# Altium schematic sheet Encoder_Sheet1.SchDoc
size 420 x 297 mm; SheetNumber: 10; SheetTotal: 26
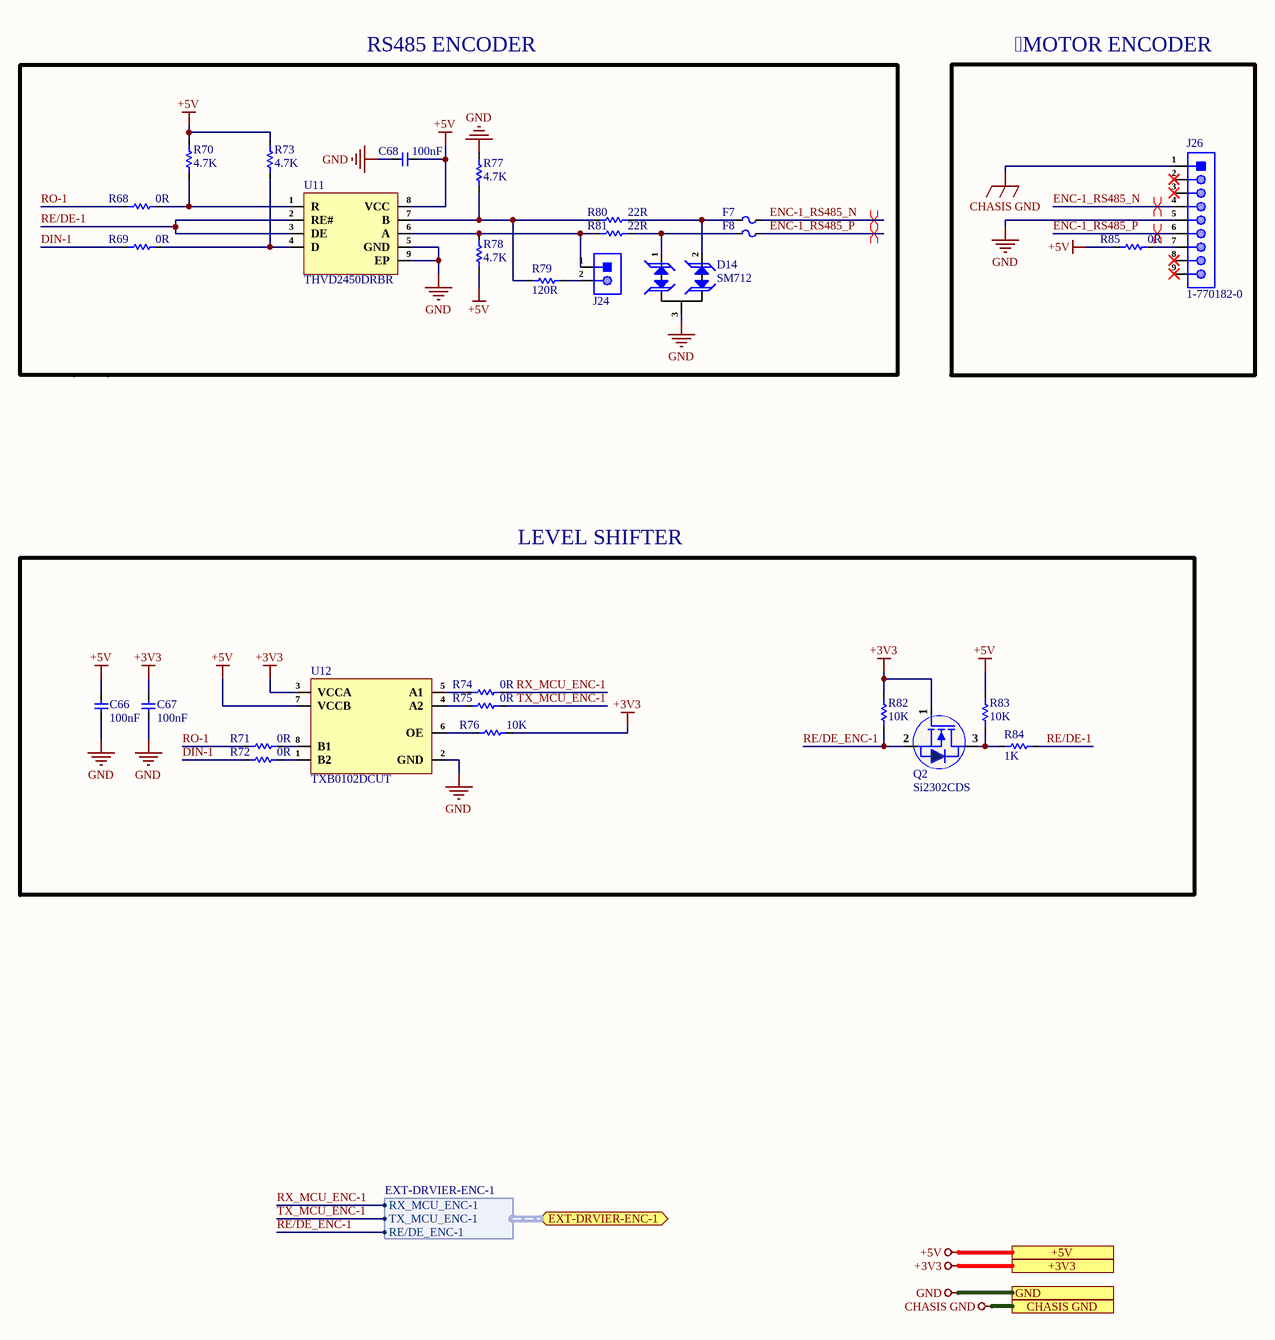
[diagram p0: Encoder_Sheet1.SchDoc]

## Parts
C66  100nF  [cap-0402]
C67  100nF  [cap-0402]
C68  100nF  [cap-0402]
D14  SM712  [SOT-23]
F7  MF-MSMF010-2  [Fuse-1812_]  (value not drawn)
F8  MF-MSMF010-2  [Fuse-1812_]  (value not drawn)
J24  X6511WV-02H-C60D30  [HDR1X2_]  (value not drawn)
J26  1-770182-0  [1-770182-0]
Q2  Si2302CDS  [Sot-23]
R68  0R  [Res-0402]
R69  0R  [Res-0402]
R70  4.7K  [Res-0402]
R71  0R  [Res-0402]
R72  0R  [Res-0402]
R73  4.7K  [Res-0402]
R74  0R  [Res-0402]
R75  0R  [Res-0402]
R76  10K  [Res-0402]
R77  4.7K  [Res-0402]
R78  4.7K  [Res-0402]
R79  120R  [Res-0603]
R80  22R  [Res-0201]
R81  22R  [Res-0201]
R82  10K  [Res-0402]
R83  10K  [Res-0402]
R84  1K  [Res-0603]
R85  0R  [Res-0402]
U11  THVD2450DRBR  [SON-8-EP(3x3)]
U12  TXB0102DCUT  [TXB0102DCUT]

## Ports
+3V3 (see Servo1[5B], CAN_Sheet[4D], Controller_Sheet[5D], DIO_1[5D], DIO_2[5D], DIO_3[5D], DIO_4[5D], Encoder_Sheet2[4D], Encoder_Sheet3[4D], Encoder_Sheet4[5D], EtherCAT_Sheet[5D], Motor_Driver_Sheet1[5D], Motor_Driver_Sheet2[5D], Motor_Driver_Sheet3[5D], Motor_Driver_Sheet4[5D], Power_Sheet[5D], RS485_RS232_Sheet[5D], Sec_Controller_Sheet1[5D], Sec_Controller_Sheet2[5D], Sec_Controller_Sheet3[5D], Sec_Controller_Sheet4[5D], Servo1[5D], Servo2[5D], Servo3[5D], Servo4[5D]), +5V (see Servo1[5B], CAN_Sheet[4D], Controller_Sheet[5D], DIO_1[5D], DIO_2[5D], DIO_3[5D], DIO_4[5D], Encoder_Sheet2[4D], Encoder_Sheet3[4D], Encoder_Sheet4[5D], Power_Sheet[5D], Servo1[5D], Servo2[5D], Servo3[5D], Servo4[5D]), CHASIS GND (see Servo1[5B], DIO_1[5D], DIO_2[5D], DIO_3[5D], DIO_4[5D], Encoder_Sheet2[4D], Encoder_Sheet3[4D], Encoder_Sheet4[5D], EtherCAT_Sheet[5D], Power_Sheet[5D], Servo1[5D], Servo2[5D], Servo3[5D], Servo4[5D]), EXT-DRVIER-ENC-1 (bidir, harness EXT-DRVIER-ENC-1, see Servo1[5B], Sec_Controller_Sheet1[3D]), GND (see Servo1[5B], CAN_Sheet[4D], Controller_Sheet[5D], DIO_1[5D], DIO_2[5D], DIO_3[5D], DIO_4[5D], Encoder_Sheet2[4D], Encoder_Sheet3[4D], Encoder_Sheet4[5D], EtherCAT_Sheet[5D], Motor_Driver_Sheet1[5D], Motor_Driver_Sheet2[5D], Motor_Driver_Sheet3[5D], Motor_Driver_Sheet4[5D], Power_Sheet[5D], RS485_RS232_Sheet[5D], Sec_Controller_Sheet1[5D], Sec_Controller_Sheet2[5D], Sec_Controller_Sheet3[5D], Sec_Controller_Sheet4[5D], Servo1[5D], Servo2[5D], Servo3[5D], Servo4[5D])

## Harnesses
EXT-DRVIER-ENC-1: RX_MCU_ENC-1, TX_MCU_ENC-1, RE/DE_ENC-1

## Nets
+3V3: C67.2 Q2.1(G) R76.2 R82.1 U12.3(VCCA) ; port +3V3
+5V: C66.2 C68.1 R70.2 R73.2 R78.1 R83.1 R85.1 U11.8(VCC) U12.7(VCCB) ; port +5V
CHASIS GND: J26.1 ; port CHASIS GND
GND: C66.1 C67.1 C68.2 D14.3(GND) J26.5 R77.2 U11.5(GND) U11.9(EP) U12.2(GND) ; port GND
DIN-1: R69.1 R72.1
ENC-1_RS485_N: F7.2 J26.4
ENC-1_RS485_P: F8.2 J26.6
RE/DE-1: R84.2 U11.2(RE#) U11.3(DE)
RE/DE_ENC-1: Q2.2(S) R82.2 ; port EXT-DRVIER-ENC-1.RE/DE_ENC-1
RO-1: R68.1 R71.1
RX_MCU_ENC-1: R74.2 ; port EXT-DRVIER-ENC-1.RX_MCU_ENC-1
TX_MCU_ENC-1: R75.2 ; port EXT-DRVIER-ENC-1.TX_MCU_ENC-1
NetD14_1: D14.1(I/O1) F8.1 R81.2
NetD14_2: D14.2(I/O2) F7.1 R80.2
NetJ24_1: J24.1 R78.2 R81.1 U11.6(A)
NetJ24_2: J24.2 R79.2
NetJ26_7: J26.7 R85.2
NetQ2_3: Q2.3(D) R83.2 R84.1
NetR68_2: R68.2 R70.1 U11.1(R)
NetR69_2: R69.2 R73.1 U11.4(D)
NetR71_2: R71.2 U12.8(B1)
NetR72_2: R72.2 U12.1(B2)
NetR74_1: R74.1 U12.5(A1)
NetR75_1: R75.1 U12.4(A2)
NetR76_1: R76.1 U12.6(OE)
NetR77_1: R77.1 R79.1 R80.1 U11.7(B)

Not connected (* = marked no-connect by the designer): J26 2* 3* 8* 9*

## Layout directives
differential pair; net class RS485; differential pair class RS485_LINES; rule Impedance Constraint [Min = 115.0    Max = 125.0    ]; rule Matched Net Lengths [Tolerance = 0.508mm]: ENC-1_RS485_N, ENC-1_RS485_P

## Notes on the sheet
- RS485 ENCODER
- MOTOR ENCODER
- LEVEL SHIFTER
- File:
- Title:
- Date:
- Page
- Num:
- Total:
- Drawn By: Huzaifa Ali

## Library data of the parts
C66-C68 = C1005X7R1H104KT000F: CAP CER 0.1UF 50V X7R 0402; Manufacturer: TDK; Tolerance: 10%; Voltage: 25V; Item Type: Capacitor; Supplier 1: Avnet; Manufacturer Part Number: C1005X7R1H104KT000F; RoHS: No; Category: Ceramic Capacitors; Dielectric: X7R; Supplier Part Number 1: C1005X7R1H104KT000F; LCSC Part Number: C361198; ComponentLink1Description: LCSC; ComponentLink1URL: https://www.lcsc.com/product-detail/Multilayer-Ceramic-Capacitors-MLCC-SMD-SMT_TDK-C1005X7R1H104KT000F_C361198.html
D14 = SM712: SOT-23 TVS ROHS; Manufacturer: TECH PUBLIC; Item Type: Diode; Manufacturer Part Number: SM712; Package: SOT-23; LCSC Part Number: C521963; ComponentLink1Description: LCSC; ComponentLink1URL: https://www.lcsc.com/product-detail/TVS_TECH-PUBLIC-SM712_C521963.html
F7 F8 = MF-MSMF010-2: 60V 100mA 40A 300mA 1812 Resettable Fuses ROHS; Manufacturer: Bourns; Time to Trip: 1.5s; Item Type: Fuse; Supplier 1: Arrow Electronics; Manufacturer Part Number: MF-MSMF010-2; RoHS: Yes; Category: Fuses; Stock 1: 75000; Pricing 1: 3000=0.1392 (USD); Mounting Technology: Surface Mount; Case Code (Imperial): 1812; Case Code (Metric): 4532; Min Operating Temperature: -40°C; Max Operating Temperature: 85°C; Packaging: Cut Tape; Max Current Rating: 40A; Hold Current: 100mA; Trip Current: 300mA; Series: Multifuse®, MF-MSMF; Voltage Rating: 60V; Ratings: AEC-Q200; RoHS Compliant: Yes; ComponentLink1URL: http://www.farnell.com/datasheets/2264697.pdf?src-supplier=Farnell; ComponentLink1Description: http://www.farnell.com/datasheets/2264697.pdf?src-supplier=Farnell; ComponentLink2URL: http://www.farnell.com/datasheets/2264697.pdf?src-supplier=Newark; ComponentLink2Description: http://www.farnell.com/datasheets/2264697.pdf?src-supplier=Newark; ComponentLink3URL: http://www.farnell.com/datasheets/2264697.pdf?src-supplier=Element14; ComponentLink3Description: http://www.farnell.com/datasheets/2264697.pdf?src-supplier=Element14; ComponentLink4URL: http://www.farnell.com/datasheets/1786007.pdf?src-supplier=Newark; ComponentLink4Description: http://www.farnell.com/datasheets/1786007.pdf?src-supplier=Newark; ComponentLink5URL: https://www.bourns.com/docs/Product-Datasheets/mfmsmf.pdf?src-supplier=Digi-Key; ComponentLink5Description: https://www.bourns.com/docs/Product-Datasheets/mfmsmf.pdf?src-supplier=Digi-Key; Supplier Part Number 1: MF-MSMF010-2; LCSC Part Number: C12430
J24 = X6511WV-02H-C60D30: Gold 250V 3A Straight Square Pins 2.5mm 2P 260℃ 6mm -40℃~+105℃ 3mm 2.54mm Plugin Black Brass 1x2P Plugin,P=2.54mm Pin Headers ROHS; Manufacturer: XKB; Item Type: Male Header; Manufacturer Part Number: X6511WV-02H-C60D30; Package: Plugin,P=2.54mm; LCSC Part Number: C706874; ComponentLink1Description: LCSC; ComponentLink1URL: https://www.lcsc.com/product-detail/Pin-Headers_XKB-Connectivity-X6511WV-02H-C60D30_C706874.html
J26 = 1-770182-0: CONN HEADER VERT 9POS 4.14MM; Manufacturer: TE Connectivity; Item Type: Power Connectors; Supplier: Future Electronics; LCSC Part Number: C3151769; Manufacturer Part Number: 1-770182-0; RoHS: Yes; Stock: 4602; Pricing: 1=1.17, 30=1.14, 125=1.1, 300=1.08, 1250=1.03 (USD); ComponentLink1URL: https://datasheet.ciiva.com/714/eng-cd-770182-l1-714801.pdf?src-supplier=Farnell; ComponentLink1Description: https://datasheet.ciiva.com/714/eng-cd-770182-l1-714801.pdf?src-supplier=Farnell; ComponentLink2URL: https://datasheet.ciiva.com/11755/0900766b80b8608c-11755213.pdf?src-supplier=Rs; ComponentLink2Description: https://datasheet.ciiva.com/11755/0900766b80b8608c-11755213.pdf?src-supplier=Rs; ComponentLink3URL: https://datasheet.ciiva.com/16222/eng-cs-82181-softshell-high-density-0508-16222388.pdf?src-supplier=Future+Electronics; ComponentLink3Description: https://datasheet.ciiva.com/16222/eng-cs-82181-softshell-high-density-0508-16222388.pdf?src-supplier=Future+Electronics; ComponentLink4URL: https://datasheet.ciiva.com/19460/892141-19460018.pdf?src-supplier=Jameco; ComponentLink4Description: https://datasheet.ciiva.com/19460/892141-19460018.pdf?src-supplier=Jameco; ComponentLink5URL: https://datasheet.ciiva.com/41446/001231547-da-01-en-stiftsockel-180grad-1-0770182-0-41446360.pdf?src-supplier=Conrad; ComponentLink5Description: https://datasheet.ciiva.com/41446/001231547-da-01-en-stiftsockel-180grad-1-0770182-0-41446360.pdf?src-supplier=Conrad; ComponentLink6URL: https://datasheet.ciiva.com/14154/770182-eng-datasheet-14154870.pdf?src-supplier=Distrelec; ComponentLink6Description: https://datasheet.ciiva.com/14154/770182-eng-datasheet-14154870.pdf?src-supplier=Distrelec; ComponentLink7URL: https://datasheet.ciiva.com/1111/1648474-1111785.pdf?src-supplier=Element14; ComponentLink7Description: https://datasheet.ciiva.com/1111/1648474-1111785.pdf?src-supplier=Element14; ComponentLink8URL: https://datasheet.ciiva.com/15173/getdatasheetpartid-92655-15173754.pdf?src-supplier=Verical; ComponentLink8Description: https://datasheet.ciiva.com/15173/getdatasheetpartid-92655-15173754.pdf?src-supplier=Verical; ComponentLink9URL: https://datasheet.ciiva.com/3126/eng-cs-82181-softshell-high-density-0408-3126095.pdf?src-supplier=Avnet; ComponentLink9Description: https://datasheet.ciiva.com/3126/eng-cs-82181-softshell-high-density-0408-3126095.pdf?src-supplier=Avnet; ComponentLink10URL: https://datasheet.ciiva.com/30155/eng-cs-82181-softshell-high-density-0508-30155467.pdf?src-supplier=Onlinecomponents.com; ComponentLink10Description: https://datasheet.ciiva.com/30155/eng-cs-82181-softshell-high-density-0508-30155467.pdf?src-supplier=Onlinecomponents.com
Q2 = Si2302CDS: N-CHANNEL 20-V (D-S) MOSFET; Manufacturer: TECH PUBLIC; ComponentLink1Description: LCSC; ComponentLink1URL: https://www.lcsc.com/product-detail/MOSFETs_TECH-PUBLIC-SI2302CDS_C5310968.html; Manufacturer Part Number: SI2302CDS; Package: SOT-23; LCSC Part Number: C5310968; Item Type: Mosfet
R68 R69 R71 R72 R74 R75 R85 = RC0402FR-070RL: RES 0 OHM JUMPER 1/16W 0402; Manufacturer: Yageo; Item Type: Resistors; Tolerance: 1%; Power Rating: 62.5mW; Voltage Rating: 50V; Temperature Coefficient: 200ppm/°C; Max Power Dissipation: 63mW; Supplier 1: Mouser; Manufacturer Part Number: RC0402FR-070RL; RoHS: Yes; Stock 1: 8556842; Pricing 1: 1=0.10000, 10=0.01400, 50=0.01400, 100=0.00600, 1000=0.00300, 5000=0.00200, 10000=0.00100 (USD); Mount: Surface Mount; Case/Package: 0402; Contact Plating: Tin,Matte; Case Code (Imperial): 0402; Case Code (Metric): 1005; Size Code: 0402; Min Operating Temperature: -55°C; Max Operating Temperature: 155°C; Resistance: 0R; Resistor Type: Thick Film; Packaging: Tape and Reel; Termination: SMD/SMT; Features: Moisture Resistant; Series: RC; Number of Terminations: 2; Length: 1mm; Width: 0.5mm; Height: 0.35mm; Radiation Hardening: No; Lead Free: Lead Free; RoHS Compliant: Yes; ComponentLink1URL: https://datasheet.ciiva.com/8896/pyu-rc0402-51-rohs-l-6-8896149.pdf?src-supplier=Avnet; ComponentLink1Description: https://datasheet.ciiva.com/8896/pyu-rc0402-51-rohs-l-6-8896149.pdf?src-supplier=Avnet; ComponentLink2URL: https://datasheet.ciiva.com/16790/pyu-rc0402-51-rohs-l-6-r-16790444.pdf?src-supplier=Future+Electronics; ComponentLink2Description: https://datasheet.ciiva.com/16790/pyu-rc0402-51-rohs-l-6-r-16790444.pdf?src-supplier=Future+Electronics; Supplier Part Number 1: 603-RC0402FR-070RL; LCSC Part Number: C106231
R70 R73 R77 R78 = RC0402FR-074K7L: RES 4.7K OHM 1% 1/16W 0402; Manufacturer: Yageo; Voltage Rating (DC): 50V; Power Rating: 62.5mW; Resistance: 4.7kR; Temperature Coefficient: 100ppm/°C; Max Power Dissipation: 63mW; Item Type: Resistor; Supplier 1: Avnet; Manufacturer Part Number: RC0402FR-074K7L; RoHS: Yes; Category: Chip SMD Resistors; Stock 1: 2420000; Pricing 1: 10000=0.00085 (USD); Case/Package: 0402; Number of Pins: 2; Case Code (Imperial): 0402; Case Code (Metric): 1005; Size Code: 0402; Min Operating Temperature: -55°C; Max Operating Temperature: 155°C; Tolerance: 1%; Voltage Rating: 50V; Packaging: Tape and Reel; Resistor Type: Thick Film; Termination: SMD/SMT; Features: Moisture Resistant; Series: RC; Number of Terminations: 2; Resistance Tolerance: 1%; Construction: Rectangular; Length: 1mm; Width: 0.5mm; Height: 0.32mm; Depth: 0.5mm; Height - Seated (Max): 0.016inch; RoHS Compliant: Yes; Reach SVHC Compliant: Yes; Military Standard: Not; Lead Free: Lead Free; ComponentLink1URL: https://datasheet.ciiva.com/22661/1686128-22661342.pdf?src-supplier=Element14; ComponentLink1Description: https://datasheet.ciiva.com/22661/1686128-22661342.pdf?src-supplier=Element14; ComponentLink2URL: https://datasheet.ciiva.com/7850/1018594-7850022.pdf?src-supplier=Element14; ComponentLink2Description: https://datasheet.ciiva.com/7850/1018594-7850022.pdf?src-supplier=Element14; ComponentLink3URL: https://datasheet.ciiva.com/7850/1018594-7850023.pdf?src-supplier=Element14; ComponentLink3Description: https://datasheet.ciiva.com/7850/1018594-7850023.pdf?src-supplier=Element14; ComponentLink4URL: https://datasheet.ciiva.com/15215/getdatasheetpartid-328119-15215035.pdf?src-supplier=Verical; ComponentLink4Description: https://datasheet.ciiva.com/15215/getdatasheetpartid-328119-15215035.pdf?src-supplier=Verical; Supplier Part Number 1: RC0402FR-074K7L; LCSC Part Number: C105871
R76 R82 R83 = RC0402FR-0710KL: RES 10K OHM 1% 1/16W 0402; Manufacturer: Yageo; Resistance: 10kR; Voltage Rating (DC): 50V; Temperature Coefficient: 100ppm/°C; Power Rating: 62.5mW; Max Power Dissipation: 63mW; Item Type: Resistor; Supplier 1: Mouser; Manufacturer Part Number: RC0402FR-0710KL; RoHS: Yes; Category: Chip SMD Resistors; Stock 1: 18648329; Pricing 1: 1=0.10000, 10=0.01400, 50=0.01400, 100=0.00500, 1000=0.00300, 10000=0.00200 (USD); Case/Package: 0402; Number of Pins: 2; Case Code (Imperial): 0402; Case Code (Metric): 1005; Min Operating Temperature: -55°C; Max Operating Temperature: 155°C; Resistor Type: Thick Film; Tolerance: 1%; Packaging: Tape and Reel; Voltage Rating: 50V; Termination: SMD/SMT; Working Voltage: 50V; Number of Terminations: 2; Features: Moisture Resistant; Series: RC; Resistance Tolerance: 1%; Construction: Rectangular; Length: 1mm; Width: 0.5mm; Height: 0.32mm; Depth: 0.5mm; Lead Pitch: 0.2mm; REACH SVHC: No SVHC; Lead Free: Lead Free; RoHS Compliant: Yes; Military Standard: Not; ComponentLink1URL: https://datasheet.ciiva.com/7660/38568-7660787.pdf?src-supplier=Element14; ComponentLink1Description: https://datasheet.ciiva.com/7660/38568-7660787.pdf?src-supplier=Element14; ComponentLink2URL: https://datasheet.ciiva.com/7849/1686128-7849814.pdf?src-supplier=Element14; ComponentLink2Description: https://datasheet.ciiva.com/7849/1686128-7849814.pdf?src-supplier=Element14; ComponentLink3URL: https://datasheet.ciiva.com/7983/1018594-7983486.pdf?src-supplier=Element14; ComponentLink3Description: https://datasheet.ciiva.com/7983/1018594-7983486.pdf?src-supplier=Element14; ComponentLink4URL: https://datasheet.ciiva.com/22747/1018594-22747512.pdf?src-supplier=Element14; ComponentLink4Description: https://datasheet.ciiva.com/22747/1018594-22747512.pdf?src-supplier=Element14; ComponentLink5URL: https://datasheet.ciiva.com/12667/pyu-rc0402-51-rohs-l-6-r-12667067.pdf?src-supplier=Mouser; ComponentLink5Description: https://datasheet.ciiva.com/12667/pyu-rc0402-51-rohs-l-6-r-12667067.pdf?src-supplier=Mouser; ComponentLink6URL: https://datasheet.ciiva.com/7849/1784430-7849813.pdf?src-supplier=Element14; ComponentLink6Description: https://datasheet.ciiva.com/7849/1784430-7849813.pdf?src-supplier=Element14; ComponentLink7URL: https://datasheet.ciiva.com/7849/1784430-7849815.pdf?src-supplier=Element14; ComponentLink7Description: https://datasheet.ciiva.com/7849/1784430-7849815.pdf?src-supplier=Element14; Supplier Part Number 1: 603-RC0402FR-0710KL; LCSC Part Number: C60490
R79 = RC0603JR-07120RL: RES 120 OHM 5% 1/10W 0603; Manufacturer: Yageo; Voltage Rating (AC): 50V; Item Type: Resistor; Supplier: Future Electronics; Supplier Part Number: 4045720; Manufacturer Part Number: RC0603JR-07120RL; RoHS: Yes; Category: Chip SMD Resistors; Stock: 570000; Pricing: 5000=0.0015, 75000=0.0015, 250000=0.0014, 750000=0.0013, 2500000=0.0012 (USD); ComponentLink1URL: https://datasheet.ciiva.com/15189/getdatasheetpartid-326532-15189850.pdf?src-supplier=Verical; ComponentLink1Description: https://datasheet.ciiva.com/15189/getdatasheetpartid-326532-15189850.pdf?src-supplier=Verical; ComponentLink2URL: https://datasheet.ciiva.com/2518/pyu-r-int-thick-7-2518850.pdf?src-supplier=Digi-Key; ComponentLink2Description: https://datasheet.ciiva.com/2518/pyu-r-int-thick-7-2518850.pdf?src-supplier=Digi-Key; ComponentLink3URL: https://datasheet.ciiva.com/2518/pyu-r-int-thick-7-2518851.pdf?src-supplier=Digi-Key; ComponentLink3Description: https://datasheet.ciiva.com/2518/pyu-r-int-thick-7-2518851.pdf?src-supplier=Digi-Key; ComponentLink4URL: https://datasheet.ciiva.com/2518/pyu-r-int-thick-7-2518852.pdf?src-supplier=Digi-Key; ComponentLink4Description: https://datasheet.ciiva.com/2518/pyu-r-int-thick-7-2518852.pdf?src-supplier=Digi-Key; ComponentLink5URL: https://datasheet.ciiva.com/46395/443971-46395070.pdf?src-supplier=Element14; ComponentLink5Description: https://datasheet.ciiva.com/46395/443971-46395070.pdf?src-supplier=Element14; ComponentLink6URL: https://datasheet.ciiva.com/12555/rc0603-272842-12555246.pdf?src-supplier=Mouser; ComponentLink6Description: https://datasheet.ciiva.com/12555/rc0603-272842-12555246.pdf?src-supplier=Mouser; LCSC Part Number: C114681
R80 R81 = RC0201FR-0722RL: RES 22 OHM 1% 1/20W 0201; Manufacturer: Yageo; Item Type: Resistor; Supplier: Future Electronics; Supplier Part Number: 5973409; Manufacturer Part Number: RC0201FR-0722RL; RoHS: Yes; Category: Chip SMD Resistors; Stock: 17980000; Pricing: 10000=0.0014, 50000=0.0013, 250000=0.0013, 750000=0.0012, 2000000=0.0011 (USD); ComponentLink1URL: https://datasheet.ciiva.com/7672/1563626-7672215.pdf?src-supplier=Element14; ComponentLink1Description: https://datasheet.ciiva.com/7672/1563626-7672215.pdf?src-supplier=Element14; LCSC Part Number: C155743
R84 = RC0603FR-071KL: RES SMD 1K OHM 1% 1/10W 0603; Manufacturer: Yageo; Resistance: 1kR; Temperature Coefficient: 100ppm/°C; Power Rating: 100mW; Voltage Rating: 50V; Item type: Resistor; ComponentLink1URL: https://www.verical.com/server-webapp/html/getDatasheet?partID=409289&src-supplier=Verical; ComponentLink1Description: https://www.verical.com/server-webapp/html/getDatasheet?partID=409289&src-supplier=Verical; Supplier 1: Digi-Key; Manufacturer Part Number: RC0603FR-071KL; Stock 1: 21472395; Pricing 1: 1=0.1, 10=0.023, 100=0.0094, 1000=0.0042, 2500=0.0037 (USD); Case/Package: 0603; Contact Plating: Tin,Matte; Case Code (Imperial): 0603; Case Code (Metric): 1608; Min Operating Temperature: -55°C; Max Operating Temperature: 155°C; Tolerance: 1%; Composition: Thick Film; Packaging: Tape and Reel; Termination: SMD/SMT; Military Standard: Not; Length: 1.6mm; Height: 0.45mm; Depth: 0.8mm; Radiation Hardening: No; REACH SVHC: No SVHC; Lead Free: Lead Free; ComponentLink2URL: http://documents.rs-components.com/techlib://itc_doclist_GB.htm?stockno=5048928&src-supplier=RSComponents; ComponentLink2Description: http://documents.rs-components.com/techlib://itc_doclist_GB.htm?stockno=5048928&src-supplier=RSComponents; ComponentLink3URL: http://www.yageo.com/documents/recent/PYu-RC0603_51_RoHS_L_4.pdf?src-supplier=Avnet+Europe; ComponentLink3Description: http://www.yageo.com/documents/recent/PYu-RC0603_51_RoHS_L_4.pdf?src-supplier=Avnet+Europe; ComponentLink4URL: http://www.farnell.com/datasheets/2167052.pdf?src-supplier=Element14; ComponentLink4Description: http://www.farnell.com/datasheets/2167052.pdf?src-supplier=Element14; ComponentLink5URL: http://www.farnell.com/datasheets/1868787.pdf?src-supplier=Element14; ComponentLink5Description: http://www.farnell.com/datasheets/1868787.pdf?src-supplier=Element14; ComponentLink6URL: http://www.yageo.com/documents/recent/PYu-RC_Group_51_RoHS_L_2.pdf?src-supplier=Avnet; ComponentLink6Description: http://www.yageo.com/documents/recent/PYu-RC_Group_51_RoHS_L_2.pdf?src-supplier=Avnet; ComponentLink7URL: https://www.verical.com/server-webapp/html/getDatasheet?partID=404327&src-supplier=Verical; ComponentLink7Description: https://www.verical.com/server-webapp/html/getDatasheet?partID=404327&src-supplier=Verical; ComponentLink8URL: http://www.farnell.com/datasheets/443971.pdf?src-supplier=Element14; ComponentLink8Description: http://www.farnell.com/datasheets/443971.pdf?src-supplier=Element14; Supplier Part Number 1: 311-1.00KHRDKR-ND; LCSC Part Number: C22548
U11 = THVD2450DRBR: IC TRANSCEIVER HALF 1/1 8SON; Manufacturer: Texas Instruments; Supplier: Digikey; Supplier Part Number: 296-THVD2450DRBRCT-ND; Manufacturer Part Number: THVD2450DRBR; RoHS: Yes; Item Type: IC; Stock: 2652; Pricing: 1=4.05, 10=3.639, 25=3.4404, 100=2.9818, 250=2.82892, 500=2.53838, 1000=2.1408 (USD); Pins: 8NUMBER; Length: 3mm; Width: 3mm; Height: 1mm; Thickness: 880um; LCSC Part Number: C2878080
U12 = TXB0102DCUT: IC TRNSLTR BIDIRECTIONAL US8; Manufacturer: Texas Instruments; Propagation Delay: 31ns; Min Supply Voltage: 1.65V; Max Supply Voltage: 5.5V; Data Rate: 100Mbps; Number of Channels: 2; Logic Function: Translator; Turn-On Delay Time: 7.4ns; High Level Output Current: -20uA; Low Level Output Current: 20uA; Output Type: 3-STATE; Output Current: 50mA; Supplier 1: Arrow Electronics; Manufacturer Part Number: TXB0102DCUT; RoHS: Yes; Category: Integrated Circuits (ICs); Stock 1: 10; Pricing 1: 1=0.79330, 10=0.66470, 25=0.65820, 250=0.37450, 500=0.36200, 1000=0.29770, 2500=0.28440 (USD); Mount: Surface Mount; Case/Package: VSSOP; Number of Pins: 8; Weight: 0.000339oz; Contact Plating: Gold; Min Operating Temperature: -40°C; Max Operating Temperature: 85°C; Packaging: Tape and Reel; Package Quantity: 1; Number of Bits: 2; Series: -; Number of Inputs: 2; Length: 2.3mm; Width: 2mm; Height: 0.85mm; Radiation Hardening: No; Lead Free: Lead Free; RoHS Compliant: Yes; REACH SVHC: No SVHC; ComponentLink1URL: https://datasheet.ciiva.com/4226/sces641b-4226901.pdf?src-supplier=Arrow+Electronics; ComponentLink1Description: https://datasheet.ciiva.com/4226/sces641b-4226901.pdf?src-supplier=Arrow+Electronics; ComponentLink2URL: https://datasheet.ciiva.com/15096/getdatasheetpartid-226009-15096242.pdf?src-supplier=Verical; ComponentLink2Description: https://datasheet.ciiva.com/15096/getdatasheetpartid-226009-15096242.pdf?src-supplier=Verical; ComponentLink3URL: https://datasheet.ciiva.com/14287/txb0102-14287498.pdf?src-supplier=Avnet; ComponentLink3Description: https://datasheet.ciiva.com/14287/txb0102-14287498.pdf?src-supplier=Avnet; ComponentLink4URL: https://datasheet.ciiva.com/14287/txb0102-14287370.pdf?src-supplier=Avnet; ComponentLink4Description: https://datasheet.ciiva.com/14287/txb0102-14287370.pdf?src-supplier=Avnet; ComponentLink5URL: https://datasheet.ciiva.com/6619/txb0102-6619255.pdf?src-supplier=Digi-Key; ComponentLink5Description: https://datasheet.ciiva.com/6619/txb0102-6619255.pdf?src-supplier=Digi-Key; ComponentLink6URL: https://datasheet.ciiva.com/6619/txb0102-6619256.pdf?src-supplier=Digi-Key; ComponentLink6Description: https://datasheet.ciiva.com/6619/txb0102-6619256.pdf?src-supplier=Digi-Key; ComponentLink7URL: https://datasheet.ciiva.com/6619/txb0102-6619257.pdf?src-supplier=Digi-Key; ComponentLink7Description: https://datasheet.ciiva.com/6619/txb0102-6619257.pdf?src-supplier=Digi-Key; Supplier Part Number 1: TXB0102DCUT